# Altium schematic sheet osc.SchDoc: OSC
size A4; CompanyName: AGH University of Krakow; Engineer: Jakub Kwiecień; Revision: 1; SheetNumber: 3; SheetTotal: 4
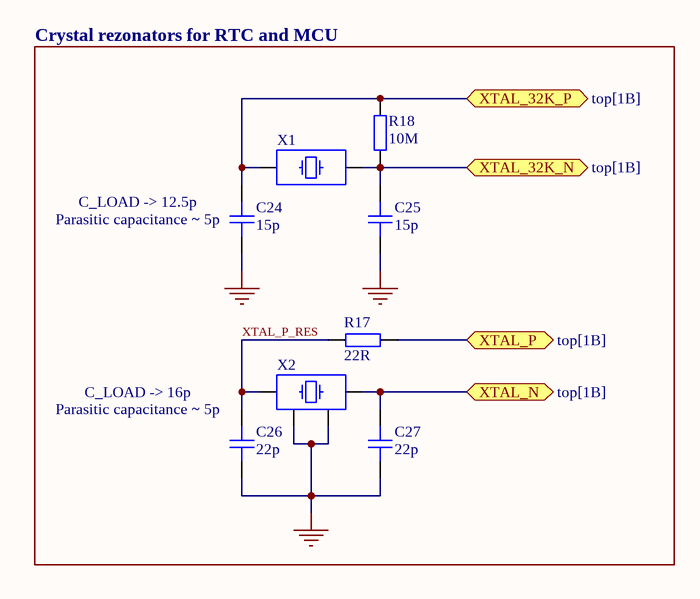
[diagram p0: osc.SchDoc]

## Parts
C24  15p  [CAP_0603]
C25  15p  [CAP_0603]
C26  22p  [CAP_0603]
C27  22p  [CAP_0603]
R17  22R  [RES_0603]
R18  10M  [RES_0603]
X1  XTAL_3215_NO_GND  [LFXTAL009678REEL]  (value not drawn)
X2  XTAL_3225  [LFXTAL035270BULK]  (value not drawn)

## Ports
XTAL_32K_N (bidir, see top[1B]), XTAL_32K_P (bidir, see top[1B]), XTAL_N (bidir, see top[1B]), XTAL_P (bidir, see top[1B])

## Nets
GND: C24.1 C25.1 C26.1 C27.1 X2.2 X2.4
XTAL_32K_N: C25.2 R18.1 X1.2 ; port XTAL_32K_N
XTAL_32K_P: C24.2 R18.2 X1.1 ; port XTAL_32K_P
XTAL_N: C27.2 X2.3 ; port XTAL_N
XTAL_P: R17.2 ; port XTAL_P
XTAL_P_RES: C26.2 R17.1 X2.1

## Notes on the sheet
- Crystal rezonators for RTC and MCU
- (near C24) C_LOAD -> 12.5p
- (near C24) Parasitic capacitance ~ 5p
- C_LOAD -> 16p
- (near C26) Parasitic capacitance ~ 5p
- Project name:
- Title:
- Company:
- Engineer:
- Modified:
- Revision:

## Library data of the parts
C24 C25 = CAP_0603: Capacitor SMD 0603; Manufacturer: Samsung; Manufacturer Part Number: CL10C150JB8NNNC; ComponentLink1Description: Distributor Link; ComponentLink1URL: https://www.tme.eu/pl/details/cl10c150jb8nnnc/kondensatory-mlcc-smd/samsung/
C26 C27 = CAP_0603: Capacitor SMD 0603; Manufacturer: Samsung; Manufacturer Part Number: CL10C220JB8NNND; ComponentLink1Description: Distributor Link; ComponentLink1URL: https://www.tme.eu/pl/details/cl10c220jb8nnnd/kondensatory-mlcc-smd/samsung/
R17 = RES_0603: Resistor SMD 0603; Manufacturer: *; Manufacturer Part Number: *; ComponentLink1Description: Distributor Link; ComponentLink1URL: *
R18 = RES_0603: Resistor SMD 0603; Manufacturer: YAGEO; Manufacturer Part Number: RC0603FR-0710ML; ComponentLink1Description: Distributor Link; ComponentLink1URL: https://www.tme.eu/pl/details/rc0603fr-0710ml/rezystory-smd/yageo/
X1 = XTAL_32.768kHz: 32.768kHz crystal LFXTAL009678REEL; Manufacturer: IQD; Manufacturer Part Number: LFXTAL009678REEL; ComponentLink1Description: Distributor Link; ComponentLink1URL: https://www.tme.eu/pl/details/32.768k-cfpx217/rezonatory-kwarcowe-smd/iqd-frequency-products/lfxtal009678reel/; ComponentLink2Description: Datasheet; ComponentLink2URL: https://www.tme.eu/Document/9d29c46a8f969343ffbdc62856e136c9/LFXTAL009678.pdf
X2 = XTAL_40MHz: 40MHz crystal LFXTAL035270BULK; Manufacturer: IQD; Manufacturer Part Number: LFXTAL035270BULK; ComponentLink1Description: Distributor Link; ComponentLink1URL: https://www.tme.eu/pl/details/40.00m-cfpx180/rezonatory-kwarcowe-smd/iqd-frequency-products/lfxtal035270bulk/